# Altium schematic sheet P05_ECG.SchDoc
size C
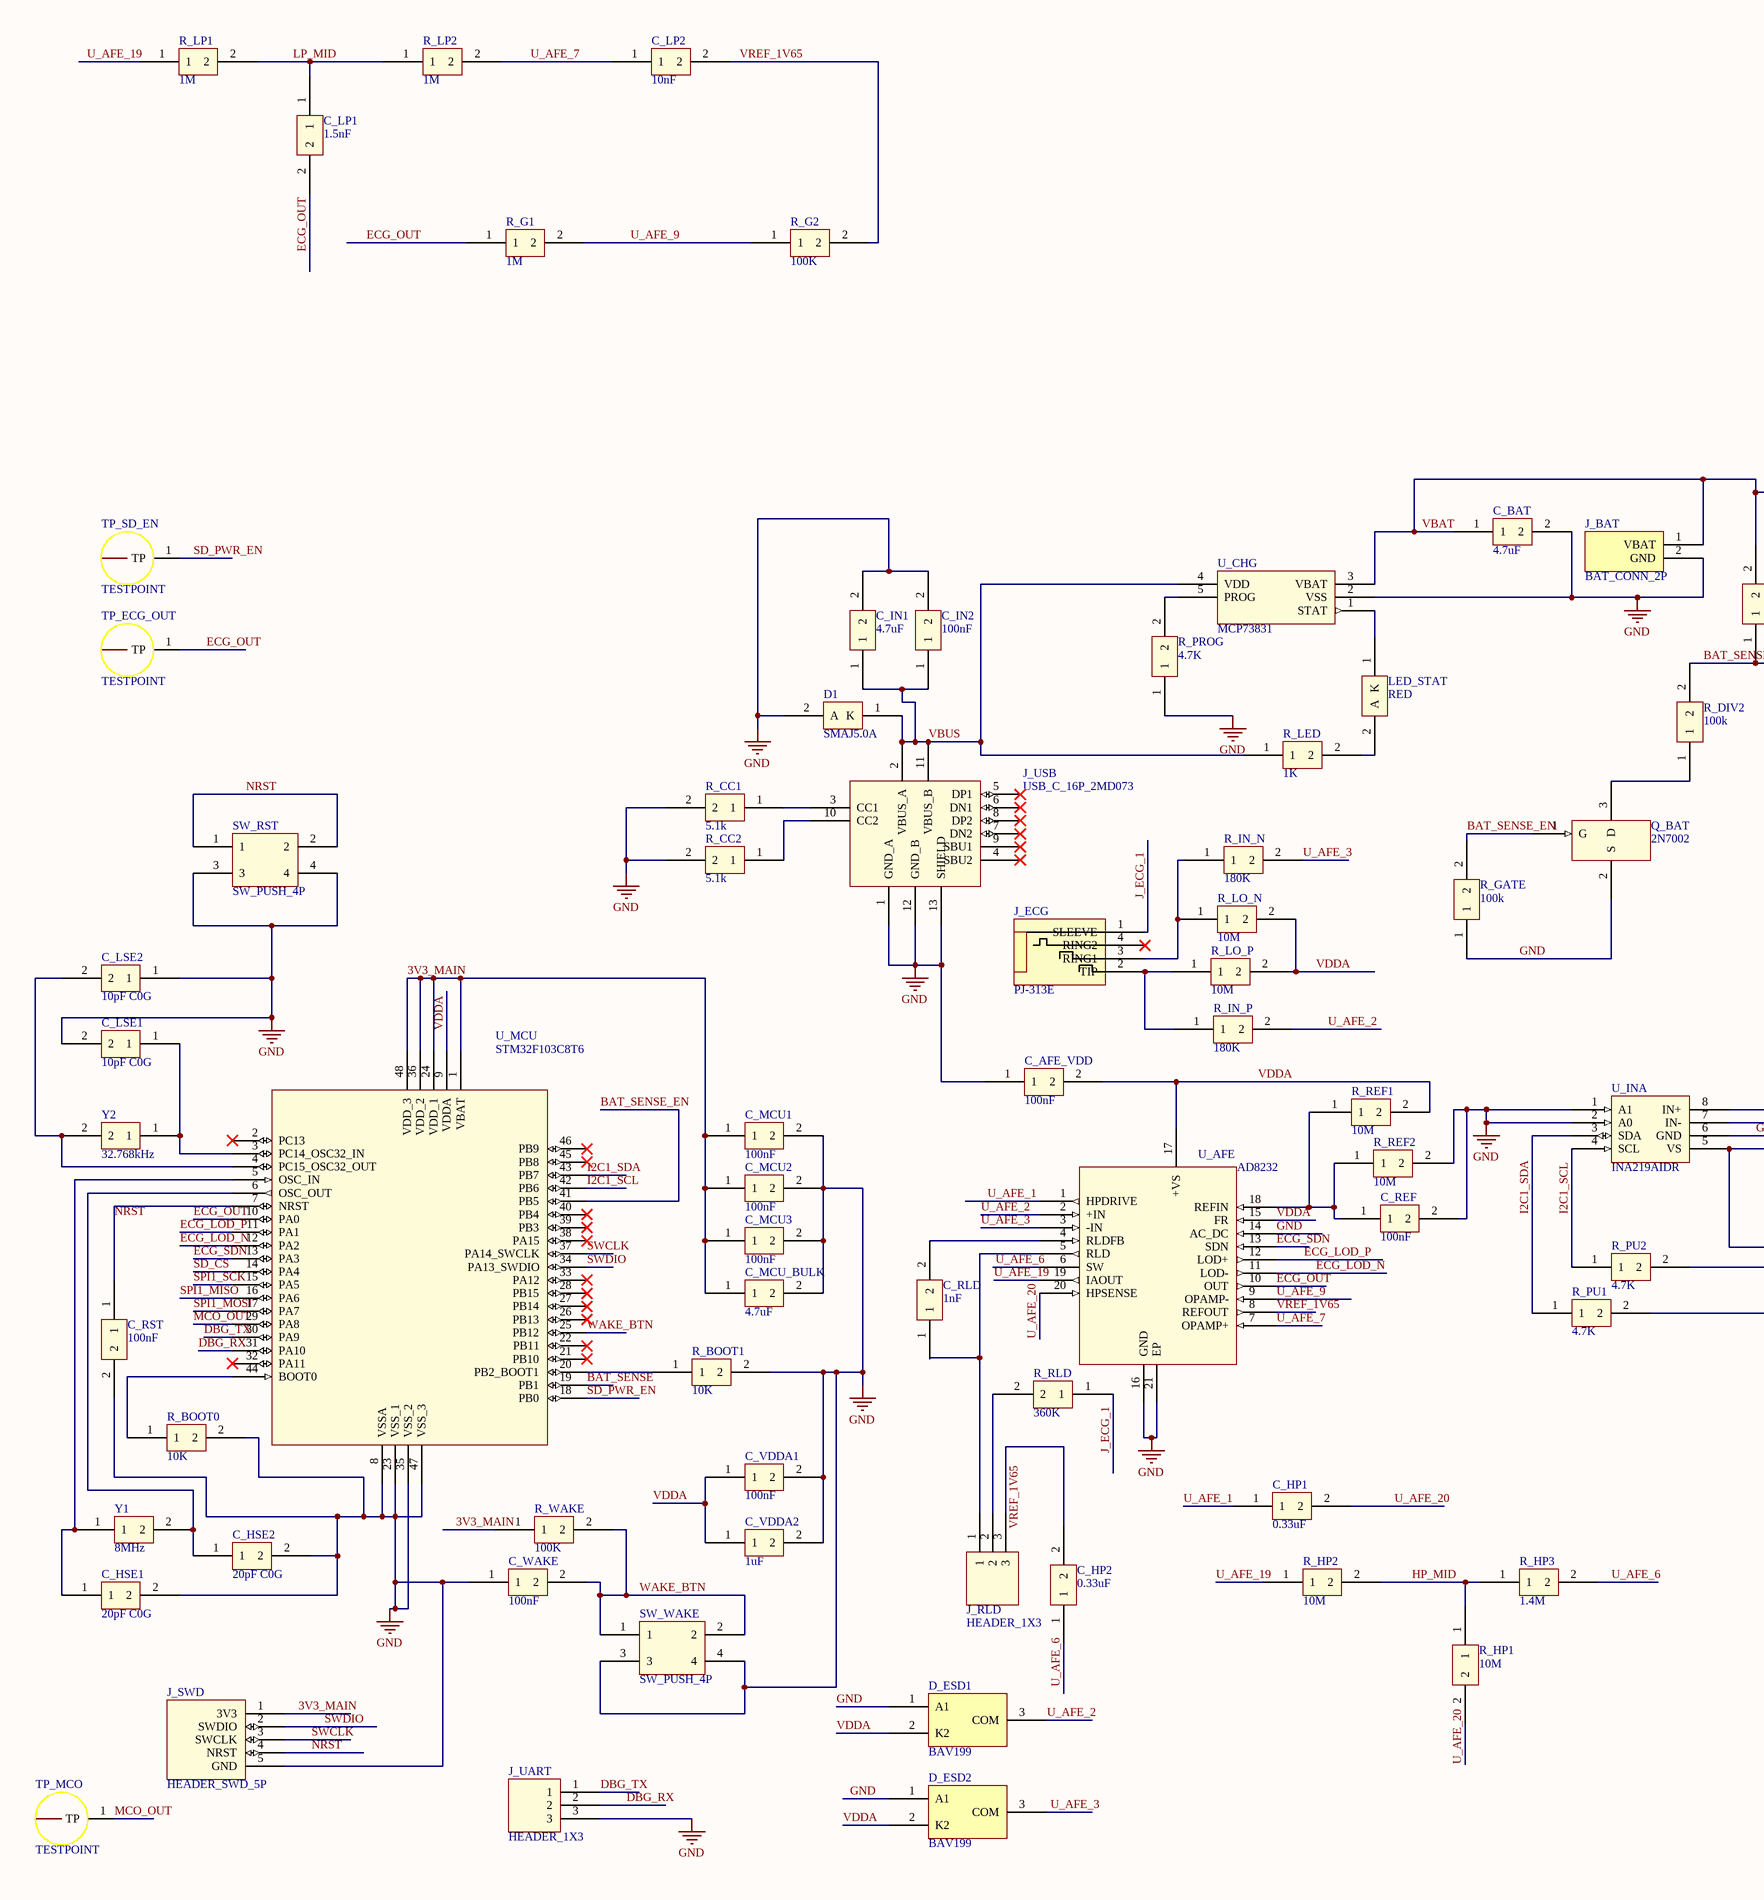
[diagram p0: P05_ECG.SchDoc, left]
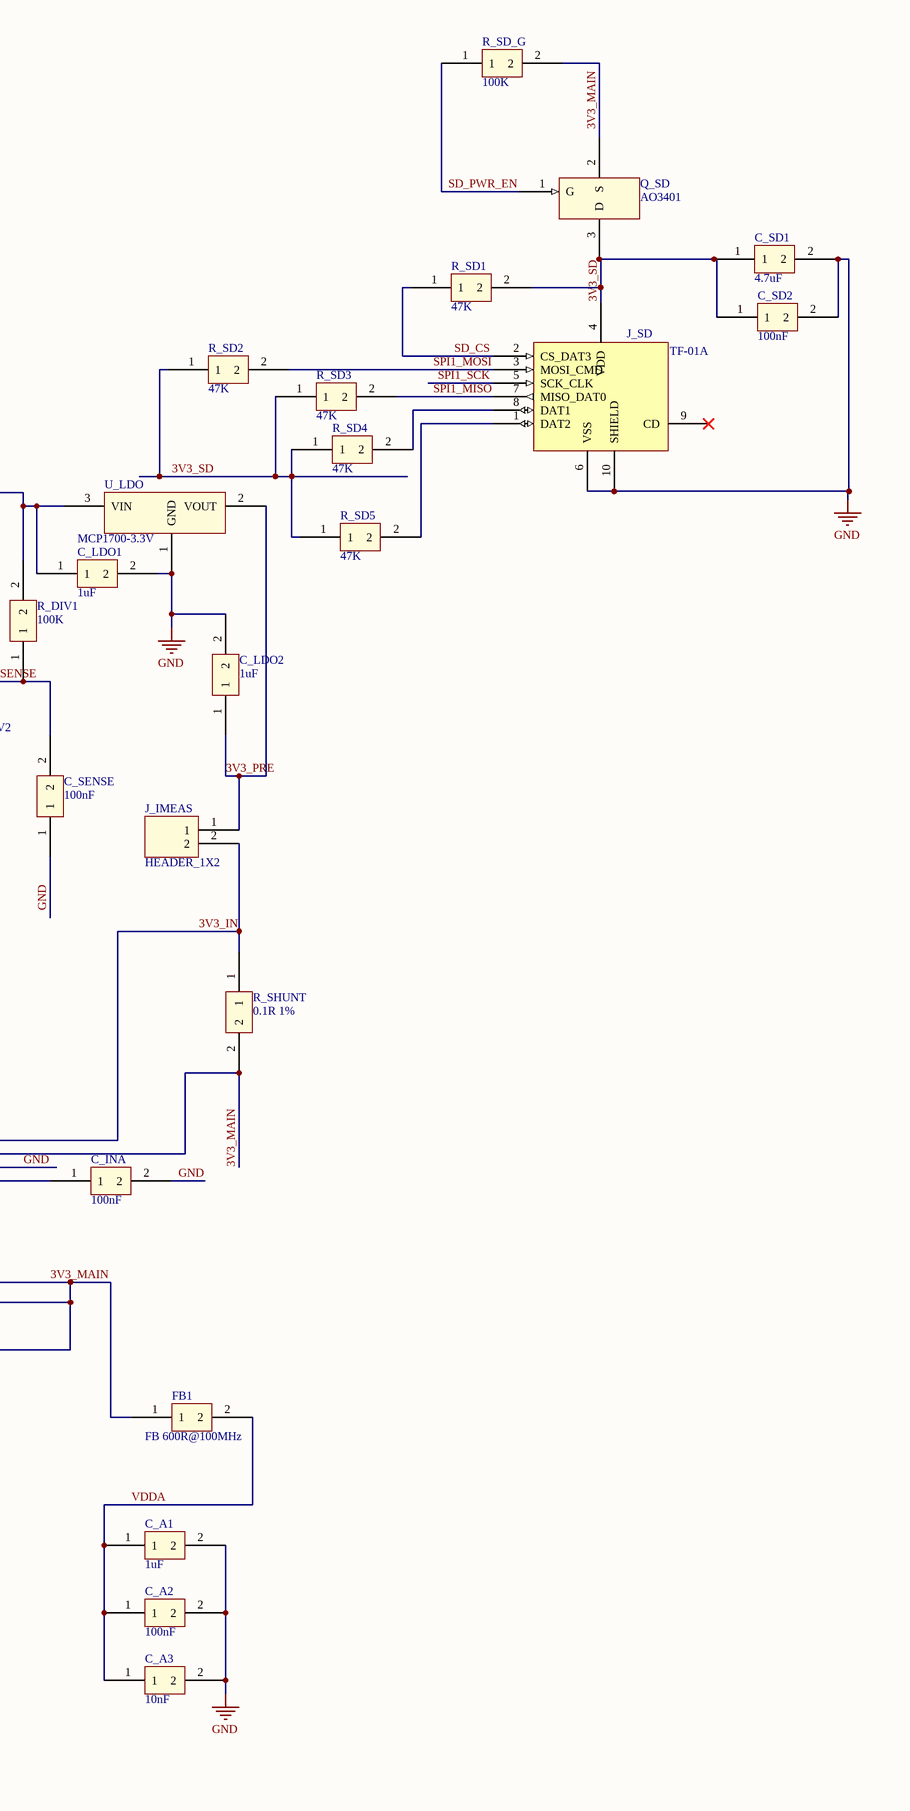
[diagram p1: P05_ECG.SchDoc, right]

## Parts
C_A1  1uF  [CHIP_0603]
C_A2  100nF  [CHIP_0603]
C_A3  10nF  [CHIP_0603]
C_AFE_VDD  100nF  [CHIP_0603]
C_BAT  4.7uF  [CHIP_0603]
C_HP1  0.33uF  [CAP_0805]
C_HP2  0.33uF  [CAP_0805]
C_HSE1  20pF C0G  [CHIP_0603]
C_HSE2  20pF C0G  [CHIP_0603]
C_IN1  4.7uF  [CHIP_0603]
C_IN2  100nF  [CHIP_0603]
C_INA  100nF  [CHIP_0603]
C_LDO1  1uF  [CHIP_0603]
C_LDO2  1uF  [CHIP_0603]
C_LP1  1.5nF  [CHIP_0603]
C_LP2  10nF  [CHIP_0603]
C_LSE1  10pF C0G  [CHIP_0603]
C_LSE2  10pF C0G  [CHIP_0603]
C_MCU1  100nF  [CHIP_0603]
C_MCU2  100nF  [CHIP_0603]
C_MCU3  100nF  [CHIP_0603]
C_MCU_BULK  4.7uF  [CHIP_0603]
C_REF  100nF  [CHIP_0603]
C_RLD  1nF  [CHIP_0603]
C_RST  100nF  [CHIP_0603]
C_SD1  4.7uF  [CHIP_0603]
C_SD2  100nF  [CHIP_0603]
C_SENSE  100nF  [CHIP_0603]
C_VDDA1  100nF  [CHIP_0603]
C_VDDA2  1uF  [CHIP_0603]
C_WAKE  100nF  [CHIP_0603]
D1  SMAJ5.0A  [DIODE_SMA_DO214AC]
D_ESD1  BAV199  [SOT23_3]
D_ESD2  BAV199  [SOT23_3]
FB1  FB 600R@100MHz  [CHIP_0603]
J_BAT  BAT_CONN_2P  [JST_B2B-PH-K-S]
J_ECG  PJ-313E  [JACK_3.5MM_PJ313E]
J_IMEAS  HEADER_1X2  [HDR_1X2_P2.54]
J_RLD  HEADER_1X3  [HDR_1X3_P2.54]
J_SD  TF-01A  [TF-01A]
J_SWD  HEADER_SWD_5P  [HDR_1X5_P2.54]
J_UART  HEADER_1X3  [HDR_1X3_P2.54]
J_USB  USB_C_16P_2MD073  [USB_C_16P_2MD073]
LED_STAT  RED  [CHIP_0603]
Q_BAT  2N7002  [SOT23_3]
Q_SD  AO3401  [SOT23_3]
R_BOOT0  10K  [CHIP_0603]
R_BOOT1  10K  [CHIP_0603]
R_CC1  5.1k  [CHIP_0603]
R_CC2  5.1k  [CHIP_0603]
R_DIV1  100K  [CHIP_0603]
R_DIV2  100k  [CHIP_0603]
R_G1  1M  [CHIP_0603]
R_G2  100K  [CHIP_0603]
R_GATE  100k  [CHIP_0603]
R_HP1  10M  [CHIP_0603]
R_HP2  10M  [CHIP_0603]
R_HP3  1.4M  [CHIP_0603]
R_IN_N  180K  [CHIP_0603]
R_IN_P  180K  [CHIP_0603]
R_LED  1K  [CHIP_0603]
R_LO_N  10M  [CHIP_0603]
R_LO_P  10M  [CHIP_0603]
R_LP1  1M  [CHIP_0603]
R_LP2  1M  [CHIP_0603]
R_PROG  4.7K  [CHIP_0603]
R_PU1  4.7K  [CHIP_0603]
R_PU2  4.7K  [CHIP_0603]
R_REF1  10M  [CHIP_0603]
R_REF2  10M  [CHIP_0603]
R_RLD  360K  [CHIP_0603]
R_SD1  47K  [CHIP_0603]
R_SD2  47K  [CHIP_0603]
R_SD3  47K  [CHIP_0603]
R_SD4  47K  [CHIP_0603]
R_SD5  47K  [CHIP_0603]
R_SD_G  100K  [CHIP_0603]
R_SHUNT  0.1R 1%  [CHIP_0603]
R_WAKE  100K  [CHIP_0603]
SW_RST  SW_PUSH_4P  [SW_SMD_TS1187A]
SW_WAKE  SW_PUSH_4P  [SW_SMD_TS1187A]
TP_ECG_OUT  TESTPOINT  [TESTPOINT_1MM]
TP_MCO  TESTPOINT  [TESTPOINT_1MM]
TP_SD_EN  TESTPOINT  [TESTPOINT_1MM]
U_AFE  AD8232  [LFCSP20_4x4_P0.5]
U_CHG  MCP73831  [SOT23_5]
U_INA  INA219AIDR  [SOIC8_3.9x4.9]
U_LDO  MCP1700-3.3V  [SOT23_3]
U_MCU  STM32F103C8T6  [LQFP48_7x7_P0.5]
Y1  8MHz  [XTAL_5032_2P]
Y2  32.768kHz  [XTAL_3215]

## Nets
GND: C_A1.2 C_A2.2 C_A3.2 C_AFE_VDD.1 C_BAT.2 C_HSE1.2 C_HSE2.2 C_IN1.2 C_IN2.2 C_INA.2 C_LDO1.2 C_LDO2.2 C_LSE1.2 C_LSE2.1 C_MCU1.2 C_MCU2.2 C_MCU3.2 C_MCU_BULK.2 C_REF.2 C_RST.2 C_SD1.2 C_SD2.2 C_SENSE.1 C_VDDA1.2 C_VDDA2.2 C_WAKE.1 D1.2(A) D_ESD1.1(A1) D_ESD2.1(A1) J_BAT.2(GND) J_SD.6(VSS) J_SD.10(SHIELD) J_SWD.5(GND) J_UART.3 J_USB.1(GND_A) J_USB.12(GND_B) J_USB.13(SHIELD) Q_BAT.2(S) R_BOOT0.2 R_BOOT1.2 R_CC1.2 R_CC2.2 R_GATE.1 R_PROG.1 R_REF2.2 SW_RST.3 SW_RST.4 SW_WAKE.3 SW_WAKE.4 U_AFE.14(AC_DC) U_AFE.16(GND) U_AFE.21(EP) U_CHG.2(VSS) U_INA.1(A1) U_INA.2(A0) U_INA.6(GND) U_LDO.1(GND) U_MCU.8(VSSA) U_MCU.23(VSS_1) U_MCU.35(VSS_2) U_MCU.47(VSS_3)
3V3_IN: J_IMEAS.2 R_SHUNT.1 U_INA.8(IN+)
3V3_MAIN: C_INA.1 C_MCU1.1 C_MCU2.1 C_MCU3.1 C_MCU_BULK.1 FB1.1 J_SWD.1(3V3) Q_SD.2(S) R_PU1.2 R_PU2.2 R_SD_G.2 R_SHUNT.2 R_WAKE.1 U_INA.5(VS) U_INA.7(IN-) U_MCU.1(VBAT) U_MCU.24(VDD_1) U_MCU.36(VDD_2) U_MCU.48(VDD_3)
3V3_PRE: C_LDO2.1 J_IMEAS.1 U_LDO.2(VOUT)
3V3_SD: C_SD1.1 C_SD2.1 J_SD.4(VDD) Q_SD.3(D) R_SD1.2 R_SD2.1 R_SD3.1 R_SD4.1 R_SD5.1
BAT_SENSE: C_SENSE.2 R_DIV1.1 R_DIV2.2 U_MCU.19(PB1)
BAT_SENSE_EN: Q_BAT.1(G) R_GATE.2 U_MCU.41(PB5)
DBG_RX: J_UART.2 U_MCU.31(PA10)
DBG_TX: J_UART.1 U_MCU.30(PA9)
ECG_LOD_N: U_AFE.11(LOD-) U_MCU.12(PA2)
ECG_LOD_P: U_AFE.12(LOD+) U_MCU.11(PA1)
ECG_OUT: C_LP1.2 R_G1.1 TP_ECG_OUT.1(TP) U_AFE.10(OUT) U_MCU.10(PA0)
ECG_SDN: U_AFE.13(SDN) U_MCU.13(PA3)
HP_MID: R_HP1.1 R_HP2.2 R_HP3.1
I2C1_SCL: R_PU2.1 U_INA.4(SCL) U_MCU.42(PB6)
I2C1_SDA: R_PU1.1 U_INA.3(SDA) U_MCU.43(PB7)
J_ECG_1: J_ECG.1(SLEEVE) R_RLD.1
LP_MID: C_LP1.1 R_LP1.2 R_LP2.1
MCO_OUT: TP_MCO.1(TP) U_MCU.29(PA8)
NRST: C_RST.1 J_SWD.4(NRST) SW_RST.1 SW_RST.2 U_MCU.7(NRST)
SD_CS: J_SD.2(CS_DAT3) R_SD1.1 U_MCU.14(PA4)
SD_PWR_EN: Q_SD.1(G) R_SD_G.1 TP_SD_EN.1(TP) U_MCU.18(PB0)
SPI1_MISO: J_SD.7(MISO_DAT0) R_SD3.2 U_MCU.16(PA6)
SPI1_MOSI: J_SD.3(MOSI_CMD) R_SD2.2 U_MCU.17(PA7)
SPI1_SCK: J_SD.5(SCK_CLK) U_MCU.15(PA5)
SWCLK: J_SWD.3(SWCLK) U_MCU.37(PA14_SWCLK)
SWDIO: J_SWD.2(SWDIO) U_MCU.34(PA13_SWDIO)
U_AFE_1: C_HP1.1 U_AFE.1(HPDRIVE)
U_AFE_2: D_ESD1.3(COM) R_IN_P.2 U_AFE.2(+IN)
U_AFE_3: D_ESD2.3(COM) R_IN_N.2 U_AFE.3(-IN)
U_AFE_6: C_HP2.1 R_HP3.2 U_AFE.6(SW)
U_AFE_7: C_LP2.1 R_LP2.2 U_AFE.7(OPAMP+)
U_AFE_9: R_G1.2 R_G2.1 U_AFE.9(OPAMP-)
U_AFE_19: R_HP2.1 R_LP1.1 U_AFE.19(IAOUT)
U_AFE_20: C_HP1.2 R_HP1.2 U_AFE.20(HPSENSE)
VBAT: C_BAT.1 C_LDO1.1 J_BAT.1(VBAT) R_DIV1.2 U_CHG.3(VBAT) U_LDO.3(VIN)
VBUS: C_IN1.1 C_IN2.1 D1.1(K) J_USB.2(VBUS_A) J_USB.11(VBUS_B) R_LED.1 U_CHG.4(VDD)
VDDA: C_A1.1 C_A2.1 C_A3.1 C_AFE_VDD.2 C_VDDA1.1 C_VDDA2.1 D_ESD1.2(K2) D_ESD2.2(K2) FB1.2 R_LO_N.2 R_LO_P.2 R_REF1.2 U_AFE.15(FR) U_AFE.17(+VS) U_MCU.9(VDDA)
VREF_1V65: C_HP2.2 C_LP2.2 J_RLD.3 R_G2.2 U_AFE.8(REFOUT)
WAKE_BTN: C_WAKE.2 R_WAKE.2 SW_WAKE.1 SW_WAKE.2 U_MCU.25(PB12)
NetC_HSE1_1: C_HSE1.1 U_MCU.5(OSC_IN) Y1.1
NetC_HSE2_1: C_HSE2.1 U_MCU.6(OSC_OUT) Y1.2
NetC_LSE1_1: C_LSE1.1 U_MCU.3(PC14_OSC32_IN) Y2.1
NetC_LSE2_2: C_LSE2.2 U_MCU.4(PC15_OSC32_OUT) Y2.2
NetC_REF_1: C_REF.1 R_REF1.1 R_REF2.1 U_AFE.18(REFIN)
NetC_RLD_1: C_RLD.1 J_RLD.1 U_AFE.5(RLD)
NetC_RLD_2: C_RLD.2 U_AFE.4(RLDFB)
NetJ_ECG_2: J_ECG.2(TIP) R_IN_P.1 R_LO_P.1
NetJ_ECG_3: J_ECG.3(RING1) R_IN_N.1 R_LO_N.1
NetJ_RLD_2: J_RLD.2 R_RLD.2
NetJ_SD_1: J_SD.1(DAT2) R_SD5.2
NetJ_SD_8: J_SD.8(DAT1) R_SD4.2
NetJ_USB_3: J_USB.3(CC1) R_CC1.1
NetJ_USB_10: J_USB.10(CC2) R_CC2.1
NetLED_STAT_1: LED_STAT.1(K) U_CHG.1(STAT)
NetLED_STAT_2: LED_STAT.2(A) R_LED.2
NetQ_BAT_3: Q_BAT.3(D) R_DIV2.1
NetR_BOOT0_1: R_BOOT0.1 U_MCU.44(BOOT0)
NetR_BOOT1_1: R_BOOT1.1 U_MCU.20(PB2_BOOT1)
NetR_PROG_2: R_PROG.2 U_CHG.5(PROG)

Not connected (* = marked no-connect by the designer): J_ECG 4(RING2)*; J_SD 9(CD)*; J_USB 4(SBU2)* 5(DP1)* 6(DN1)* 7(DN2)* 8(DP2)* 9(SBU1)*; U_MCU 2(PC13)* 21(PB10)* 22(PB11)* 26(PB13)* 27(PB14)* 28(PB15)* 32(PA11)* 33(PA12)* 38(PA15)* 39(PB3)* 40(PB4)* 45(PB8)* 46(PB9)*

## Library data of the parts
C_A1-C_A3 C_AFE_VDD C_BAT C_HSE1 C_HSE2 C_IN1 C_IN2 C_INA C_LDO1 C_LDO2 C_LP1 C_LP2 C_LSE1 C_LSE2 C_MCU1-C_MCU3 C_MCU_BULK C_REF C_RLD C_RST C_SD1 C_SD2 C_SENSE C_VDDA1 C_VDDA2 C_WAKE = C_0603
C_HP1 C_HP2 = C_0805: Capacitor 0805 C0G/Film for HPF filter
D1 = SMAJ5.0A: DIODE_SMA_DO214AC
FB1 = FB_0603
J_ECG = PJ-313E: 3.5mm SMD Audio/ECG Jack
LED_STAT = LED_0603
Q_BAT = 2N7002: N-Channel MOSFET 60V 0.3A SOT-23
R_BOOT0 R_BOOT1 R_CC1 R_CC2 R_DIV1 R_DIV2 R_G1 R_G2 R_GATE R_HP1-R_HP3 R_IN_N R_IN_P R_LED R_LO_N R_LO_P R_LP1 R_LP2 R_PROG R_PU1 R_PU2 R_REF1 R_REF2 R_RLD R_SD1-R_SD5 R_SD_G R_WAKE = R_0603
R_SHUNT = R_SHUNT_0R1: Current Sense Resistor 0.1 Ohm 1% 0603
U_INA = INA219
U_LDO = MCP1700: LDO 3.3V 250mA, Iq 1.6uA.
Y1 = XTAL_8MHZ
Y2 = XTAL_32K768